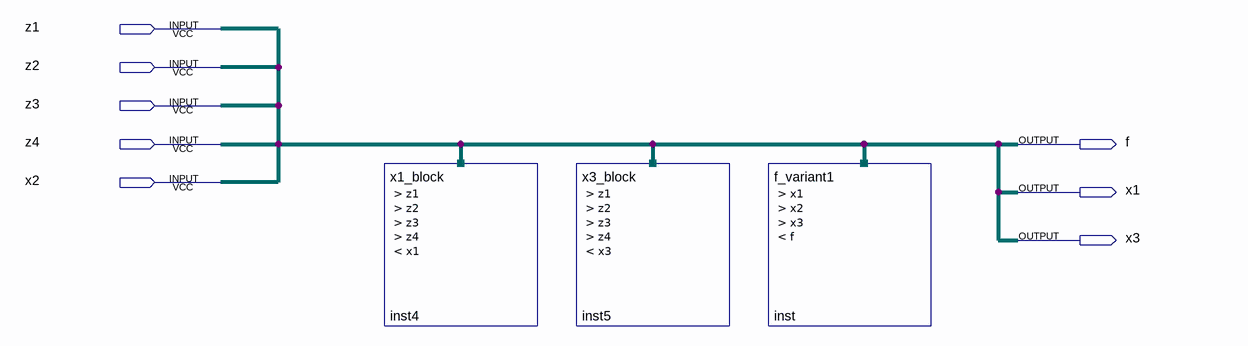
[diagram p0: schematic sheet]
// Quartus schematic blended.bdf as structural Verilog: 3 symbols, 8 pins
module blended (
  input  z1,
  input  z2,
  input  z3,
  input  z4,
  input  x2,
  output f,
  output x1,
  output x3
);

  x1_block inst4 (.z1(z1), .z2(z2), .z3(z3), .z4(z4), .x1(x1));
  x3_block inst5 (.z1(z1), .z2(z2), .z3(z3), .z4(z4), .x3(x3));
  f_variant1 inst (.x1(x1), .x2(x2), .x3(x3), .f(f));
endmodule
